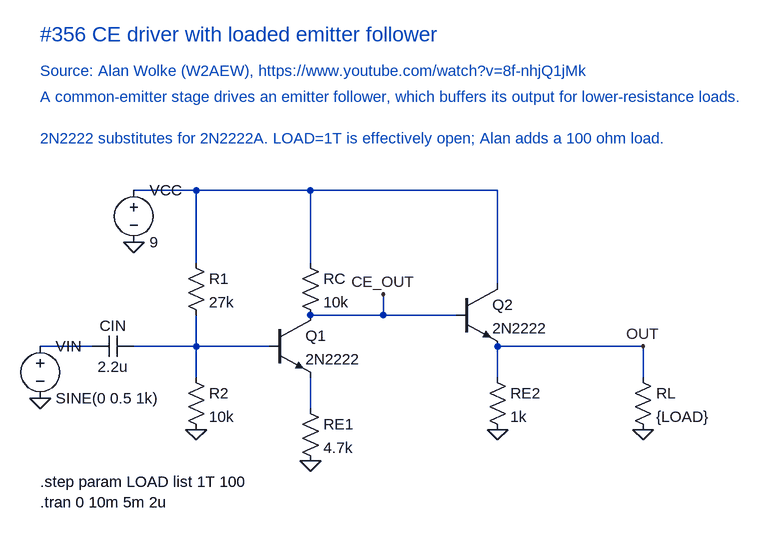
[diagram p0: schematic CE driver and loaded follower.asc]
CE driver and loaded follower.asc, the LTspice schematic file:
Version 4
SHEET 1 1312 864
WIRE 400 176 304 176
WIRE 576 176 400 176
WIRE 864 176 576 176
WIRE 400 288 400 176
WIRE 576 288 576 176
WIRE 864 320 864 176
WIRE 240 416 160 416
WIRE 400 416 304 416
WIRE 512 416 400 416
WIRE 400 416 400 368
WIRE 400 464 400 416
WIRE 688 368 576 368
WIRE 800 368 688 368
WIRE 688 336 688 368
WIRE 576 512 576 464
WIRE 864 464 864 416
WIRE 1088 416 864 416
WIRE 1088 464 1088 416
FLAG 304 256 0
FLAG 160 496 0
FLAG 400 544 0
FLAG 576 592 0
FLAG 864 544 0
FLAG 1088 544 0
FLAG 688 336 CE_OUT
FLAG 1088 416 OUT
SYMBOL voltage 304 160 R0
SYMATTR InstName VCC
SYMATTR Value 9
SYMBOL voltage 160 400 R0
SYMATTR InstName VIN
SYMATTR Value SINE(0 0.5 1k)
SYMBOL cap 304 400 R90
WINDOW 0 0 32 VBottom 2
WINDOW 3 32 32 VTop 2
SYMATTR InstName CIN
SYMATTR Value 2.2u
SYMBOL res 384 272 R0
SYMATTR InstName R1
SYMATTR Value 27k
SYMBOL res 384 448 R0
SYMATTR InstName R2
SYMATTR Value 10k
SYMBOL npn 512 368 R0
SYMATTR InstName Q1
SYMATTR Value 2N2222
SYMBOL res 560 272 R0
SYMATTR InstName RC
SYMATTR Value 10k
SYMBOL res 560 496 R0
SYMATTR InstName RE1
SYMATTR Value 4.7k
SYMBOL npn 800 320 R0
SYMATTR InstName Q2
SYMATTR Value 2N2222
SYMBOL res 848 448 R0
SYMATTR InstName RE2
SYMATTR Value 1k
SYMBOL res 1072 448 R0
SYMATTR InstName RL
SYMATTR Value {LOAD}
TEXT 160 -64 Left 3 ;#356 CE driver with loaded emitter follower
TEXT 160 -8 Left 2 ;Source: Alan Wolke (W2AEW), https://www.youtube.com/watch?v=8f-nhjQ1jMk
TEXT 160 32 Left 2 ;A common-emitter stage drives an emitter follower, which buffers its output for lower-resistance loads.
TEXT 160 96 Left 2 ;2N2222 substitutes for 2N2222A. LOAD=1T is effectively open; Alan adds a 100 ohm load.
TEXT 160 624 Left 2 !.step param LOAD list 1T 100
TEXT 160 656 Left 2 !.tran 0 10m 5m 2u

The netlist it stands for:
* CE driver and loaded follower.asc
VCC N001 0 9
VIN N002 0 SINE(0 0.5 1k)
CIN N003 N002 2.2u
R1 N001 N003 27k
R2 N003 0 10k
Q1 CE_OUT N003 N004 0 2N2222
RC N001 CE_OUT 10k
RE1 N004 0 4.7k
Q2 N001 CE_OUT OUT 0 2N2222
RE2 OUT 0 1k
RL OUT 0 {LOAD}
.model NPN NPN
.model PNP PNP
.lib standard.bjt
* #356 CE driver with loaded emitter follower
* Source: Alan Wolke (W2AEW), https://www.youtube.com/watch?v=8f-nhjQ1jMk
* A common-emitter stage drives an emitter follower, which buffers its output for lower-resistance loads.
* 2N2222 substitutes for 2N2222A. LOAD=1T is effectively open; Alan adds a 100 ohm load.
.step param LOAD list 1T 100
.tran 0 10m 5m 2u
.backanno
.end